# Altium schematic sheet BYTE_Rib.SchDoc
size A4; SheetNumber: 1; SheetTotal: 1
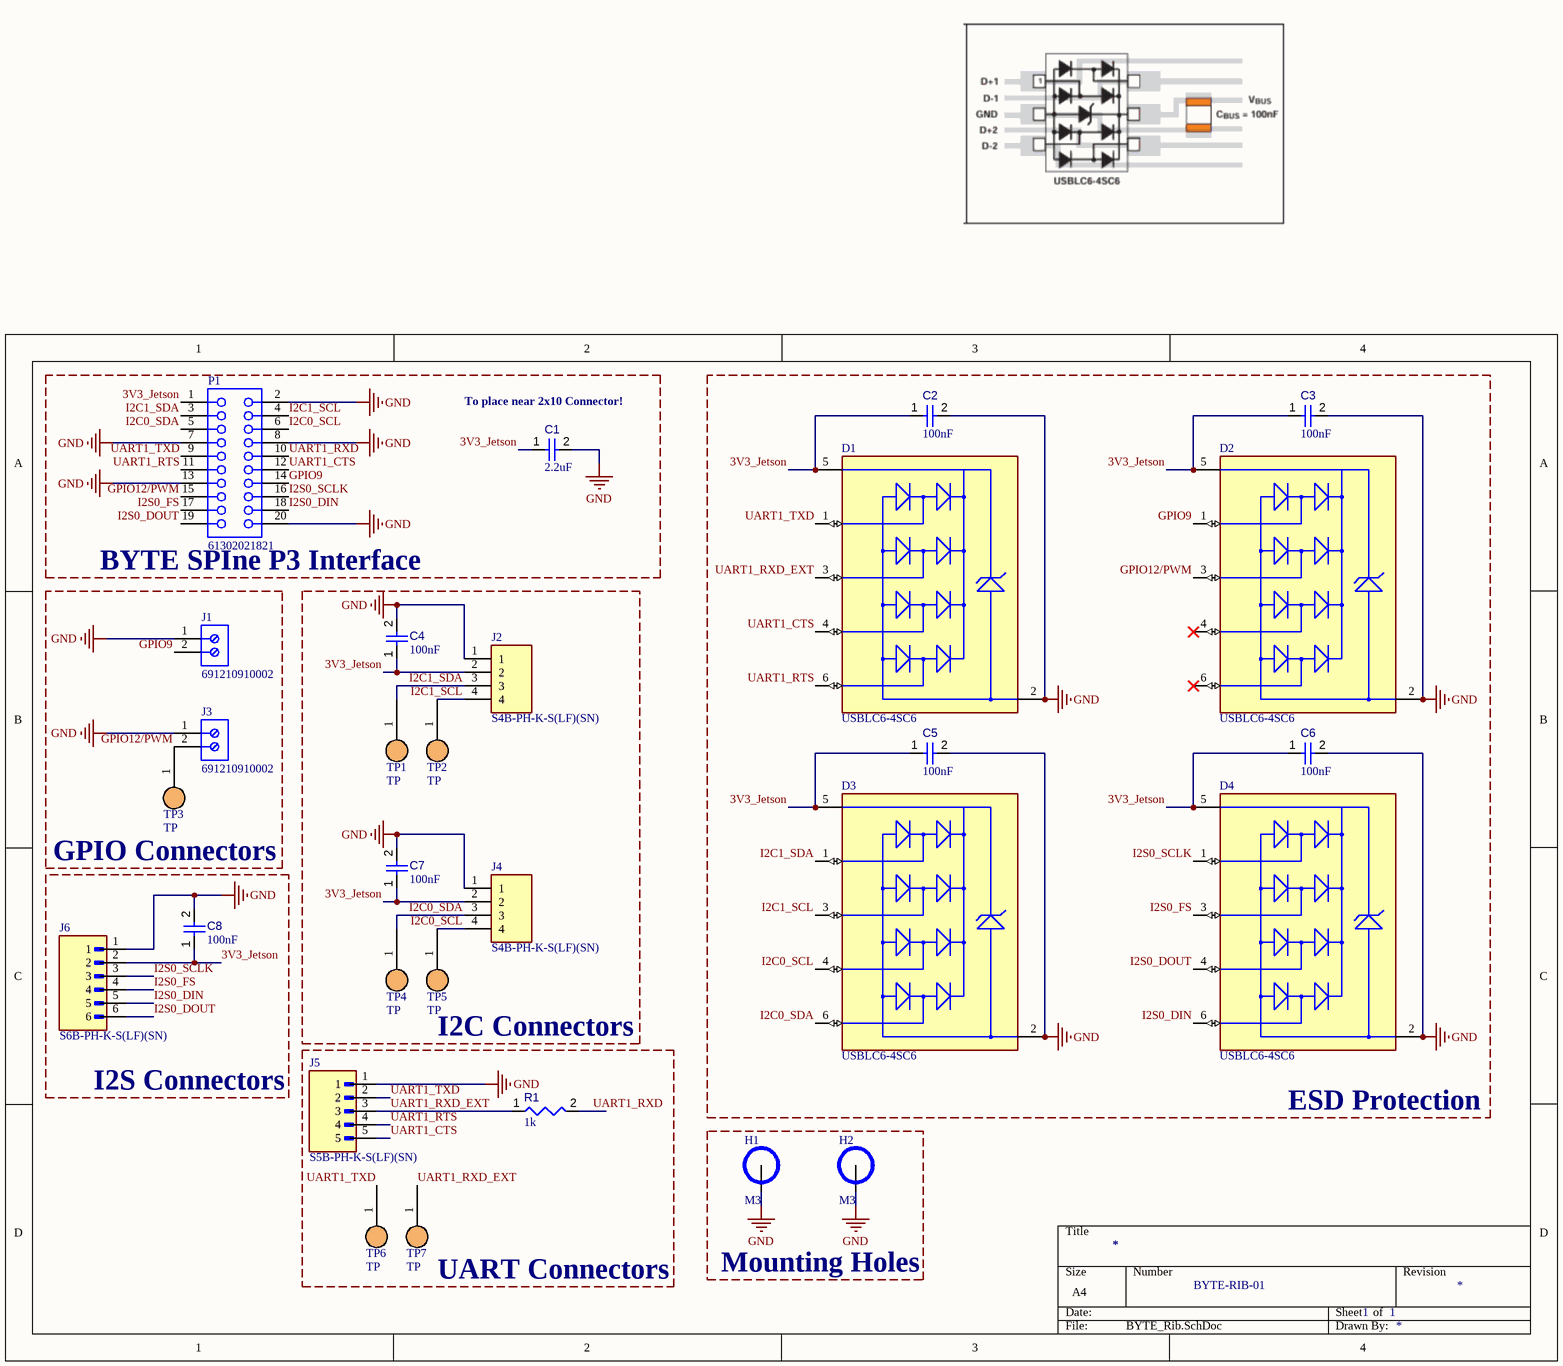
[diagram p0: BYTE_Rib.SchDoc]

## Parts
C1  2.2uF  [CAPC1608X94X35NL15T15]
C2  value 100nF  [CAPC1608X90X40NL10T20]  (hidden comment: Capacitor 100 nF +/-10% 50 V 0603)
C3  value 100nF  [CAPC1608X90X40NL10T20]  (hidden comment: Capacitor 100 nF +/-10% 50 V 0603)
C4  value 100nF  [CAPC1608X90X40NL10T20]  (hidden comment: Capacitor 100 nF +/-10% 50 V 0603)
C5  value 100nF  [CAPC1608X90X40NL10T20]  (hidden comment: Capacitor 100 nF +/-10% 50 V 0603)
C6  value 100nF  [CAPC1608X90X40NL10T20]  (hidden comment: Capacitor 100 nF +/-10% 50 V 0603)
C7  value 100nF  [CAPC1608X90X40NL10T20]  (hidden comment: Capacitor 100 nF +/-10% 50 V 0603)
C8  value 100nF  [CAPC1608X90X40NL10T20]  (hidden comment: Capacitor 100 nF +/-10% 50 V 0603)
D1  USBLC6-4SC6  [FP-SOT23-6L-MFG]
D2  USBLC6-4SC6  [FP-SOT23-6L-MFG]
D3  USBLC6-4SC6  [FP-SOT23-6L-MFG]
D4  USBLC6-4SC6  [FP-SOT23-6L-MFG]
H1  M3  [MH_M3_PTH]  (no BOM)
H2  M3  [MH_M3_PTH]  (no BOM)
J1  691210910002  [691210910002]
J2  S4B-PH-K-S(LF)(SN)  [JST_S4B-PH-K-S(LF)(SN)]
J3  691210910002  [691210910002]
J4  S4B-PH-K-S(LF)(SN)  [JST_S4B-PH-K-S(LF)(SN)]
J5  S5B-PH-K-S(LF)(SN)  [JST_S5B-PH-K-S(LF)(SN)]
J6  S6B-PH-K-S(LF)(SN)  [JST_S6B-PH-K-S(LF)(SN)]
P1  61302021821  [61302021821]
R1  1k  [RESC0603(1608)_L]
TP1  TP  [TP_SMD_D1.5]  (no BOM)
TP2  TP  [TP_SMD_D1.5]  (no BOM)
TP3  TP  [TP_SMD_D1.5]  (no BOM)
TP4  TP  [TP_SMD_D1.5]  (no BOM)
TP5  TP  [TP_SMD_D1.5]  (no BOM)
TP6  TP  [TP_SMD_D1.5]  (no BOM)
TP7  TP  [TP_SMD_D1.5]  (no BOM)

## Blocks framed on the sheet
BYTE SPIne P3 Interface: C1 P1
ESD Protection: C2 C3 C5 C6 D1-D4
I2C Connectors: C4 C7 J2 J4 TP1 TP2 TP4 TP5
Mounting Holes: H1 H2

## Nets
GND: C1.2 C2.2 C3.2 C4.2 C5.2 C6.2 C7.2 C8.2 D1.2(GND) D2.2(GND) D3.2(GND) D4.2(GND) H1.1 H2.1 J1.1 J2.1 J3.1 J4.1 J5.1 J6.1 P1.2 P1.7 P1.8 P1.13 P1.20
3V3_Jetson: C1.1 C2.1 C3.1 C4.1 C5.1 C6.1 C7.1 C8.1 D1.5(VBUS) D2.5(VBUS) D3.5(VBUS) D4.5(VBUS) J2.2 J4.2 J6.2 P1.1
GPIO9: D2.1(I/O1) J1.2 P1.14
GPIO12/PWM: D2.3(I/O2) J3.2 P1.15 TP3.1
I2C0_SCL: D3.4(I/O3) J4.4 P1.6 TP5.1
I2C0_SDA: D3.6(I/O4) J4.3 P1.5 TP4.1
I2C1_SCL: D3.3(I/O2) J2.4 P1.4 TP2.1
I2C1_SDA: D3.1(I/O1) J2.3 P1.3 TP1.1
I2S0_DIN: D4.6(I/O4) J6.5 P1.18
I2S0_DOUT: D4.4(I/O3) J6.6 P1.19
I2S0_FS: D4.3(I/O2) J6.4 P1.17
I2S0_SCLK: D4.1(I/O1) J6.3 P1.16
UART1_CTS: D1.4(I/O3) J5.5 P1.12
UART1_RTS: D1.6(I/O4) J5.4 P1.11
UART1_RXD: P1.10 R1.2
UART1_RXD_EXT: D1.3(I/O2) J5.3 R1.1 TP7.1
UART1_TXD: D1.1(I/O1) J5.2 P1.9 TP6.1

Not connected (* = marked no-connect by the designer): D2 4(I/O3)* 6(I/O4)*

## Notes on the sheet
- (near C1) To place near 2x10 Connector!
- GPIO Connectors
- I2S Connectors
- (near TP7) UART Connectors
- BYTE-RIB-01

## Library data of the parts
C1 = CMP-001-00003-6: Tolerance: 10%; Voltage Rating: 16V; Capacitor Type: Ceramic; Max Operating Temperature: 125°C; Pins: 2; Min Operating Temperature: -55°C; RoHS Compliant: True; Value: 2.2uF; Mounting Technology: SM; Case/Package: 0603; LCSC: C23630
C2-C8 = CMP-001-00017-6: Chip Capacitor, 100 nF, +/- 10%, 50 V, 0603 (1608 Metric); Voltage Rating: 50V; Capacitor Type: Ceramic; Tolerance: 10%; Mounting Technology: SM; Max Operating Temperature: 125°C; RoHS Compliant: True; Pins: 2; Case/Package: 0603; Min Operating Temperature: -55°C; LCSC: C14663
D1-D4 = CMP-2000-07370-2: TVS DIODE 5.25V 17V SOT23-6; Manufacturer: STMicroelectronics; Peak Pulse Power: 130W; Breakdown Voltage: 6V; Value: 3pF; Direction: Unidirectional; Interface: USB,Ethernet,Other; Number Of Channels: 4; Standoff Height: 0mm; Max Junction Temp: +125°C; Digikey Description: TVS DIODE 5.25V 17V SOT23-6; Automotive: No; Package: SOT23-6L; Mouser Description: USBLC6 Series 4 Line 6 V Uni / Bi-Directional ESD Protection - SOT-23-6; Octopart: https://octopart.com/usblc6-4sc6-stmicroelectronics-347147; RoHS: TRUE; ComponentLink2URL: https://upverter.com/datasheet/23dc4ffb028d868909e80577610284b194f13213.pdf; ComponentLink2Description: Datasheet; Device Class L1: Circuit Protection; Lead Free: Yes; Temperature Range High: +125°C; Device Class L2: ESD and Circuit Protection ICs; Device Class L3: unset; Capacitance: 3pF; Height: 1.45mm; Temperature Range Low: -40°C; Manufacturer Part Number: USBLC6-4SC6; Temperature: -40°C to +125°C; Category: Diode; Clamping Voltage: 17V; LCSC: C111212
H1 H2 = MH_M3_PTH
J1 J3 = CMP-1502-02456-3: Tb, Wire To Brd, R/A, 2Way, 18Awg Rohs Compliant: Yes; Voltage Rating: 150V; Number of Contacts: 2; Current Rating: 6A; RoHS: Compliant; Number of Rows: 1; Max Operating Temperature: 105°C; Height: 8.7mm; Contact Material: Tin; Min Operating Temperature: -40°C
J2 J4 = S4B-PH-K-S_(LF)(SN): Connector Header Through Hole, Right Angle 4 position 0.079 (2.00mm); MF: JST Sales; SnapEDA_Link: https://www.snapeda.com/parts/S4B-PH-K-S%20(LF)(SN)/JST/view-part/?ref=snap; Package: NON STANDARD-4 J.S.T.; Value: *; MP: S4B-PH-K-S (LF)(SN); Check_prices: https://www.snapeda.com/parts/S4B-PH-K-S%20(LF)(SN)/JST/view-part/?ref=eda
J5 = S5B-PH-K-S(LF)(SN): Connector Header Through Hole, Right Angle 5 position 0.079 (2.00mm); MF: JST Sales; SnapEDA_Link: https://www.snapeda.com/parts/S5B-PH-K-S(LF)(SN)/JST/view-part/?ref=snap; Package: NON STANDARD-5 J.S.T.; Value: *; MP: S5B-PH-K-S(LF)(SN); Check_prices: https://www.snapeda.com/parts/S5B-PH-K-S(LF)(SN)/JST/view-part/?ref=eda
J6 = S6B-PH-K-S(LF)(SN): Connector Header Through Hole, Right Angle 6 position 0.079 (2.00mm); MF: JST Sales; SnapEDA_Link: https://www.snapeda.com/parts/S6B-PH-K-S(LF)(SN)/JST/view-part/?ref=snap; Package: NON STANDARD-6 J.S.T.; Value: *; MP: S6B-PH-K-S(LF)(SN); Check_prices: https://www.snapeda.com/parts/S6B-PH-K-S(LF)(SN)/JST/view-part/?ref=eda
P1 = CMP-1502-01350-4: THT Vertical Socket Header WR-PHD, Pitch 2.54 mm, Dual Row, 20 pins; Current Rating: 3A; Gender: Female; Contact Resistance: 20mΩ; Operating Supply Voltage: 250V; Orientation: Vertical; Number of Pins: 20; Lead Pitch: 2.54mm
R1 = CMP-009-00175-3: 0603; Pins: 2; Min Operating Temperature: -55°C; Max Operating Temperature: 155°C; Case/Package: 0603; Value: 1k; LCSC: C21190
TP1-TP7 = TP_SMD_D1.5